# Altium schematic sheet LED_blink.SchDoc
size A; SheetNumber: 7; SheetTotal: 7
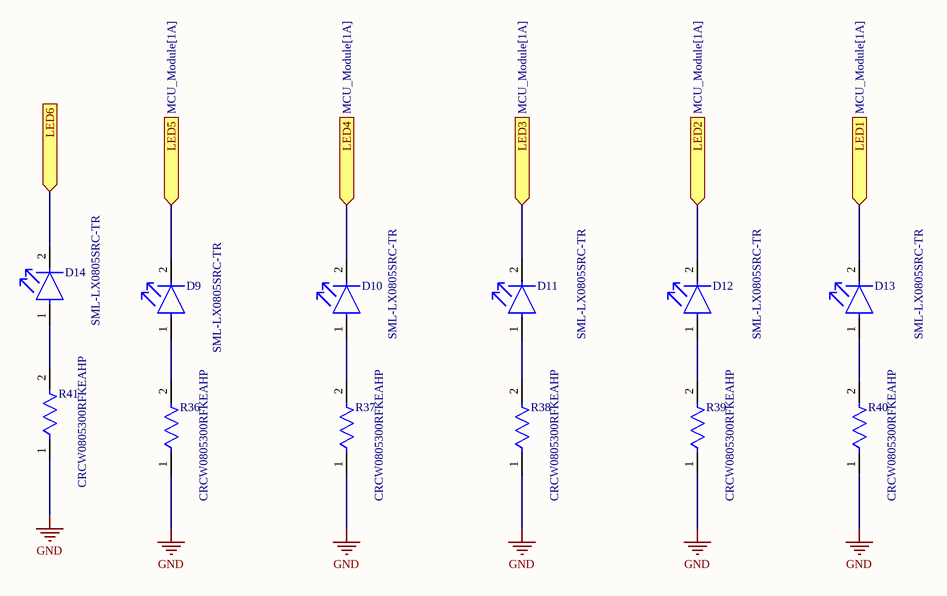
[diagram p0: LED_blink.SchDoc]

## Parts
D9  SML-LX0805SRC-TR  [FP-SML-LX0805SRC-TR-MFG]
D10  SML-LX0805SRC-TR  [FP-SML-LX0805SRC-TR-MFG]
D11  SML-LX0805SRC-TR  [FP-SML-LX0805SRC-TR-MFG]
D12  SML-LX0805SRC-TR  [FP-SML-LX0805SRC-TR-MFG]
D13  SML-LX0805SRC-TR  [FP-SML-LX0805SRC-TR-MFG]
D14  SML-LX0805SRC-TR  [FP-SML-LX0805SRC-TR-MFG]
R36  CRCW0805300RFKEAHP  [FP-CRCW0805-HPe3-IPC_A]
R37  CRCW0805300RFKEAHP  [FP-CRCW0805-HPe3-IPC_A]
R38  CRCW0805300RFKEAHP  [FP-CRCW0805-HPe3-IPC_A]
R39  CRCW0805300RFKEAHP  [FP-CRCW0805-HPe3-IPC_A]
R40  CRCW0805300RFKEAHP  [FP-CRCW0805-HPe3-IPC_A]
R41  CRCW0805300RFKEAHP  [FP-CRCW0805-HPe3-IPC_A]

## Ports
LED1 (in, see MCU_Module[1A]), LED2 (in, see MCU_Module[1A]), LED3 (in, see MCU_Module[1A]), LED4 (in, see MCU_Module[1A]), LED5 (in, see MCU_Module[1A]), LED6 (in)

## Nets
GND: R36.1 R37.1 R38.1 R39.1 R40.1 R41.1
LED1: D13.2(C) ; port LED1
LED2: D12.2(C) ; port LED2
LED3: D11.2(C) ; port LED3
LED4: D10.2(C) ; port LED4
LED5: D9.2(C) ; port LED5
LED6: D14.2(C) ; port LED6
NetD9_1: D9.1(A) R36.2
NetD10_1: D10.1(A) R37.2
NetD11_1: D11.1(A) R38.2
NetD12_1: D12.1(A) R39.2
NetD13_1: D13.1(A) R40.2
NetD14_1: D14.1(A) R41.2

## Library data of the parts
D9-D14 = CMP-57192-000013-1: LED RED CLEAR SMD; Forward Current: 20mA; Wavelength: 660nm; Forward Voltage: 1.7V; Luminous Intensity: 25mcd; Number of LEDs: 1; Current Rating: 25mA; Lens Color: Colorless; Power Rating: 100mW; Viewing Angle: 140°; Approvals: UL; Lens Transparency: Clear; Series: -; Package Quantity: 3000; Mount: Surface Mount; Lead Free: Lead Free; Case/Package: 0805; Max Operating Temperature: 85°C; Illumination Color: Red; Packaging: Tape and Reel; Length: 2mm; Lens Style: Clear; Width: 1.25mm; RoHS Compliant: Yes; Color: Red; Case Code (Metric): 2012; Dominant Wavelength: 660nm; Number of Pins: 2; Min Operating Temperature: -40°C; Case Code (Imperial): 0805; Voltage Rating (DC): 1.7V; Voltage Rating: 1.7V; Height: 1.2mm; Test Current: 20mA
R36-R41 = CMP-02407-003516-1: RES Thick Film, 300Ω, 1%, 0.5W, 100ppm/°C, 0805; Max Power Dissipation: 500mW; Power Rating: 330mW; Resistance: 300R; Width: 0.049inch; Tolerance: 1%; Composition: Thick Film; Contact Plating: Tin; Length: 0.079inch; Temperature Coefficient: 100ppm/°C; Termination: Wraparound; Lead Free: Lead Free; Height: 0.024inch; Packaging: Tape and Reel; Case/Package: 0805; Number of Terminations: 2; Min Operating Temperature: -55°C; Features: Automotive AEC-Q200; Mount: Surface Mount; Max Operating Temperature: 155°C; Package Quantity: 5000